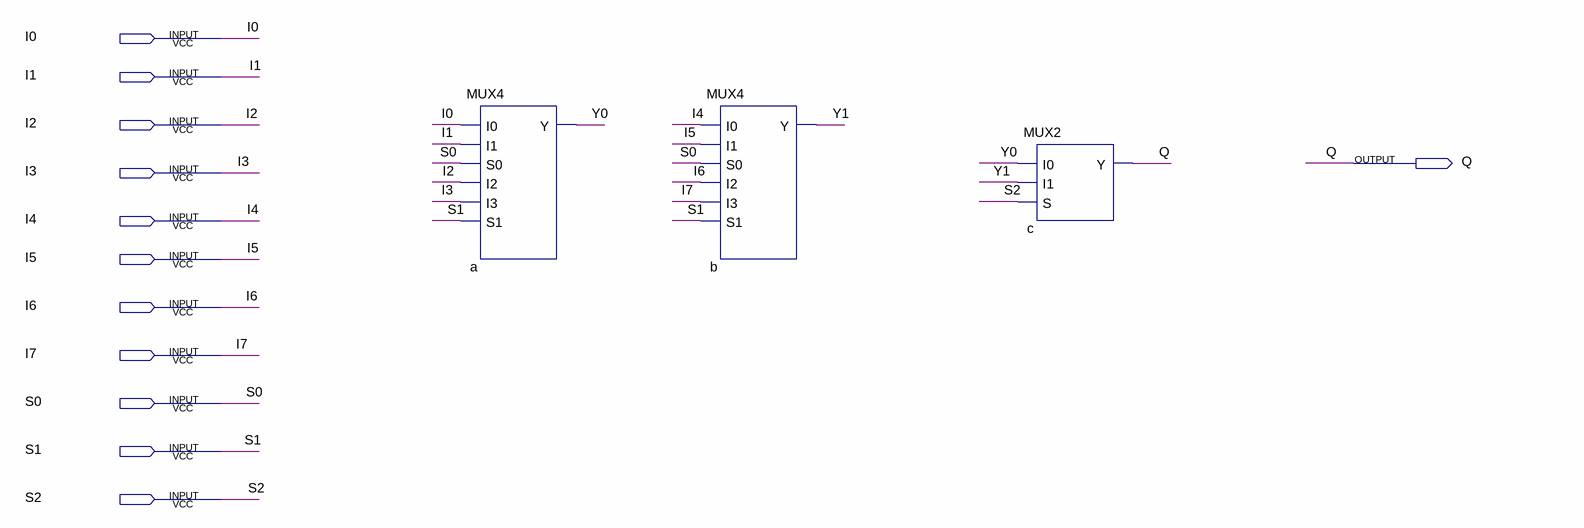
[diagram p0: schematic sheet]
// Quartus schematic MUX8.bdf as structural Verilog: 3 symbols, 12 pins
module MUX8 (
  input  I0,
  input  I1,
  input  I2,
  input  I3,
  input  I4,
  input  I5,
  input  I6,
  input  I7,
  input  S0,
  input  S1,
  input  S2,
  output Q
);

  wire Y0, Y1;

  MUX4 a (.I0(I0), .I1(I1), .S0(S0), .I2(I2), .I3(I3), .S1(S1), .Y(Y0));
  MUX4 b (.I0(I4), .I1(I5), .S0(S0), .I2(I6), .I3(I7), .S1(S1), .Y(Y1));
  MUX2 c (.I0(Y0), .I1(Y1), .S(S2), .Y(Q));
endmodule
